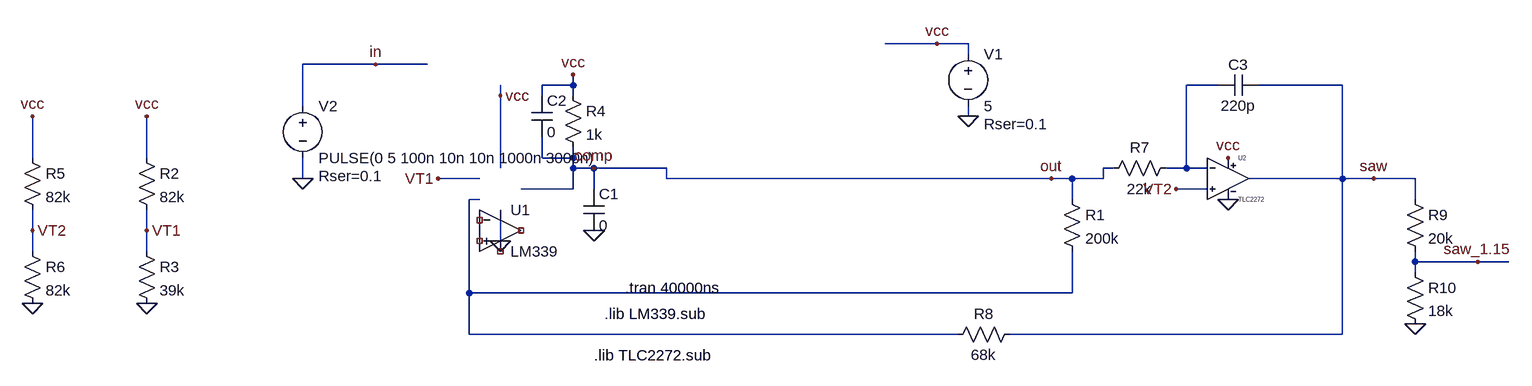
[diagram p0: schematic triangle_lm339.asc]
triangle_lm339.asc, the LTspice schematic file:
Version 4
SHEET 1 1132 680
WIRE 224 -16 144 -16
WIRE 272 -16 224 -16
WIRE 272 0 272 -16
WIRE -640 16 -752 16
WIRE -560 16 -640 16
WIRE -336 48 -336 32
WIRE -336 48 -384 48
WIRE 656 48 608 48
WIRE 848 48 720 48
WIRE -448 64 -448 48
WIRE -384 64 -384 48
WIRE -336 64 -336 48
WIRE -752 80 -752 16
WIRE 272 96 272 80
WIRE -1168 160 -1168 96
WIRE -992 160 -992 96
WIRE -384 160 -384 128
WIRE -336 160 -336 144
WIRE -336 160 -384 160
WIRE -448 176 -448 64
WIRE -336 176 -336 160
WIRE -304 176 -336 176
WIRE -192 176 -304 176
WIRE 496 176 480 176
WIRE 608 176 608 48
WIRE 608 176 576 176
WIRE 640 176 608 176
WIRE -752 192 -752 160
WIRE -480 192 -544 192
WIRE -192 192 -192 176
WIRE 400 192 -192 192
WIRE 432 192 400 192
WIRE 480 192 480 176
WIRE 480 192 432 192
WIRE 848 192 848 48
WIRE 848 192 704 192
WIRE 896 192 848 192
WIRE 960 192 896 192
WIRE -336 208 -336 176
WIRE -336 208 -416 208
WIRE -304 208 -304 176
WIRE 640 208 592 208
WIRE -480 224 -496 224
WIRE 432 224 432 192
WIRE 960 224 960 192
WIRE -1168 272 -1168 240
WIRE -992 272 -992 240
WIRE -448 288 -448 240
WIRE -1168 304 -1168 272
WIRE -992 304 -992 272
WIRE 960 320 960 304
WIRE 1056 320 960 320
WIRE 1104 320 1056 320
WIRE 960 336 960 320
WIRE -496 368 -496 224
WIRE 432 368 432 304
WIRE 432 368 -496 368
WIRE -496 432 -496 368
WIRE 256 432 -496 432
WIRE 848 432 848 192
WIRE 848 432 336 432
FLAG 272 96 0
FLAG 400 192 out
FLAG -752 192 0
FLAG 224 -16 vcc
FLAG -336 32 vcc
FLAG -640 16 in
FLAG -304 176 comp
FLAG -448 288 0
FLAG -448 64 vcc
FLAG 672 160 vcc
FLAG 672 224 0
FLAG -304 272 0
FLAG -992 384 0
FLAG -992 96 vcc
FLAG -544 192 VT1
FLAG -992 272 VT1
FLAG -1168 384 0
FLAG -1168 96 vcc
FLAG -1168 272 VT2
FLAG 592 208 VT2
FLAG 960 416 0
FLAG 896 192 saw
FLAG 1056 320 saw_1.15
SYMBOL voltage 272 -16 R0
WINDOW 123 0 0 Left 2
WINDOW 39 24 124 Left 2
SYMATTR SpiceLine Rser=0.1
SYMATTR InstName V1
SYMATTR Value 5
SYMBOL voltage -752 64 R0
WINDOW 123 0 0 Left 2
WINDOW 39 24 124 Left 2
SYMATTR SpiceLine Rser=0.1
SYMATTR InstName V2
SYMATTR Value PULSE(0 5 100n 10n 10n 1000n 3000n)
SYMBOL res 416 208 R0
SYMATTR InstName R1
SYMATTR Value 200k
SYMBOL res -352 48 R0
SYMATTR InstName R4
SYMATTR Value 1k
SYMBOL Comparators\\LM339 -448 208 R0
SYMATTR InstName U1
SYMBOL cap -400 64 R0
SYMATTR InstName C2
SYMATTR Value 0
SYMBOL res 592 160 R90
WINDOW 0 0 56 VBottom 2
WINDOW 3 32 56 VTop 2
SYMATTR InstName R7
SYMATTR Value 22k
SYMBOL cap 720 32 R90
WINDOW 0 0 32 VBottom 2
WINDOW 3 32 32 VTop 2
SYMATTR InstName C3
SYMATTR Value 220p
SYMBOL res 352 416 R90
WINDOW 0 0 56 VBottom 2
WINDOW 3 32 56 VTop 2
SYMATTR InstName R8
SYMATTR Value 68k
SYMBOL Opamps\\TLC2272 672 128 R0
SYMATTR InstName U2
SYMBOL cap -320 208 R0
SYMATTR InstName C1
SYMATTR Value 0
SYMBOL res -1008 144 R0
SYMATTR InstName R2
SYMATTR Value 82k
SYMBOL res -1008 288 R0
SYMATTR InstName R3
SYMATTR Value 39k
SYMBOL res -1184 144 R0
SYMATTR InstName R5
SYMATTR Value 82k
SYMBOL res -1184 288 R0
SYMATTR InstName R6
SYMATTR Value 82k
SYMBOL res 944 208 R0
SYMATTR InstName R9
SYMATTR Value 20k
SYMBOL res 944 320 R0
SYMATTR InstName R10
SYMATTR Value 18k
TEXT -256 360 Left 2 !.tran 40000ns
TEXT -288 400 Left 2 !.lib LM339.sub
TEXT -304 464 Left 2 !.lib TLC2272.sub

The netlist it stands for:
* triangle_lm339.asc
V1 vcc 0 5 Rser=0.1
V2 in 0 PULSE(0 5 100n 10n 10n 1000n 3000n) Rser=0.1
R1 comp N002 200k
R4 vcc comp 1k
XU1 NC_01 NC_02 0 NC_03 NC_04 LM339  ; pins In+ In- V+ V- OUT
C2 vcc comp 0
R7 N001 comp 22k
C3 saw N001 220p
R8 saw N002 68k
XU2 VT2 N001 vcc 0 saw TLC2272  ; pins In+ In- V+ V- OUT
C1 comp 0 0
R2 vcc VT1 82k
R3 VT1 0 39k
R5 vcc VT2 82k
R6 VT2 0 82k
R9 saw saw_1.15 20k
R10 saw_1.15 0 18k
.tran 40000ns
.lib LM339.sub
.lib TLC2272.sub
.lib LM339.sub
.lib LTC.lib
.backanno
.end